# EAGLE design blinky-555 (EAGLE 9.6.2)
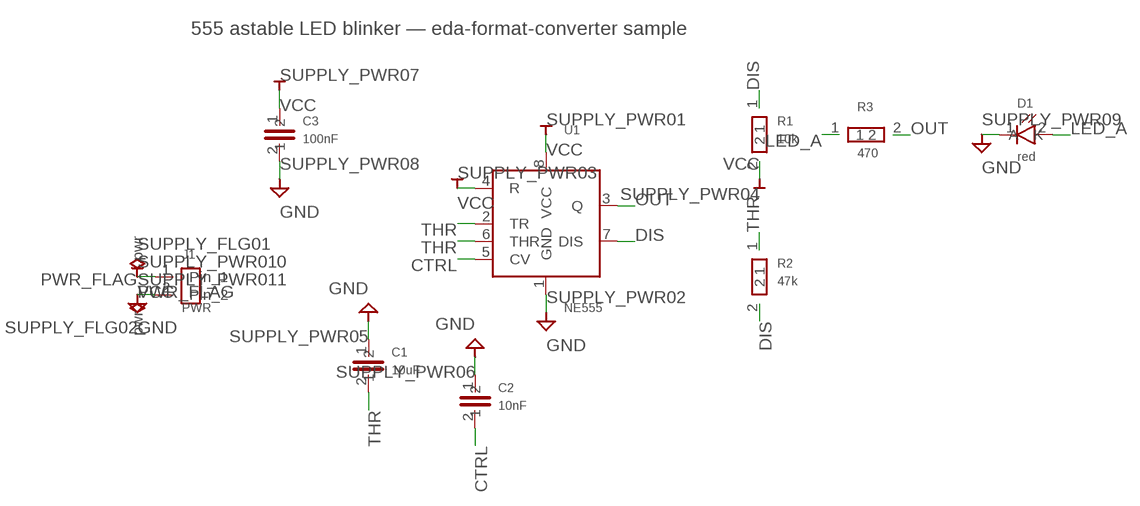
[diagram p0: schematic, sheet 1]

## Parts
C1  10uF  C  [C_PINS]
C2  10nF  C  [C_PINS]
C3  100nF  C  [C_PINS]
D1  red  LED  [LED_PINS]
J1  PWR  Conn_01x02  [PinHeader_1x02_P2.54mm_Vertical]
R1  10k  R  [R_PINS]
R2  47k  R  [R_PINS]
R3  470  R  [R_PINS]
SUPPLY_PWR01  VCC  (no package)
SUPPLY_PWR02  GND  (no package)
SUPPLY_PWR03  VCC  (no package)
SUPPLY_PWR04  VCC  (no package)
SUPPLY_PWR05  GND  (no package)
SUPPLY_PWR06  GND  (no package)
SUPPLY_PWR07  VCC  (no package)
SUPPLY_PWR08  GND  (no package)
SUPPLY_PWR09  GND  (no package)
SUPPLY_PWR010  VCC  (no package)
SUPPLY_PWR011  GND  (no package)
U1  NE555  [SOIC-8_3.9x4.9mm_P1.27mm]

## Nets
CTRL: C2.2 U1.5(CV)
DIS: R1.1 R2.2 U1.7(DIS)
GND: C1.1 C2.1 C3.2 D1.1(K) J1.2(Pin_2) SUPPLY_PWR02.GND SUPPLY_PWR05.GND SUPPLY_PWR06.GND SUPPLY_PWR08.GND SUPPLY_PWR09.GND SUPPLY_PWR011.GND U1.1(GND) ; supply symbol labelled PWR_FLAG
LED_A: D1.2(A) R3.1
OUT: R3.2 U1.3(Q)
THR: C1.2 R2.1 U1.2(TR) U1.6(THR)
VCC: C3.1 J1.1(Pin_1) R1.2 SUPPLY_PWR01.VCC SUPPLY_PWR03.VCC SUPPLY_PWR04.VCC SUPPLY_PWR07.VCC SUPPLY_PWR010.VCC U1.4(R) U1.8(VCC) ; supply symbol labelled PWR_FLAG

## Notes on the sheet
- 555 astable LED blinker — eda-format-converter sample

## Library data of the parts
C1-C3 = converted:C
D1 = converted:LED
J1 = converted:Conn_01x02
R1-R3 = converted:R
SUPPLY_PWR01 SUPPLY_PWR03 SUPPLY_PWR04 SUPPLY_PWR07 SUPPLY_PWR010 = converted:VCC
SUPPLY_PWR02 SUPPLY_PWR05 SUPPLY_PWR06 SUPPLY_PWR08 SUPPLY_PWR09 SUPPLY_PWR011 = converted:GND
U1 = converted:NE555: Precision timer

## Board
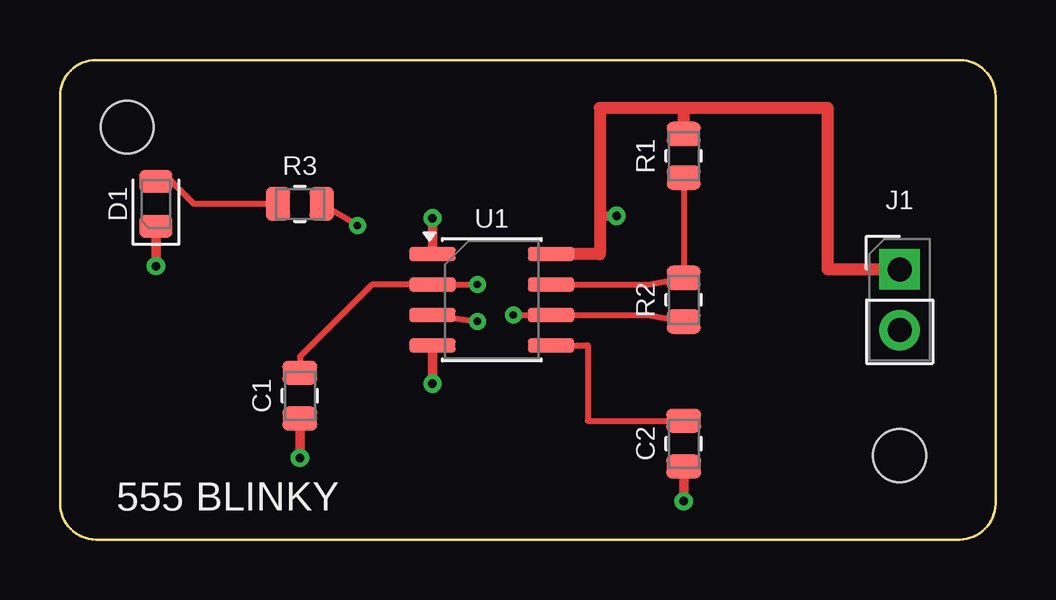
[diagram p1: board, top side]
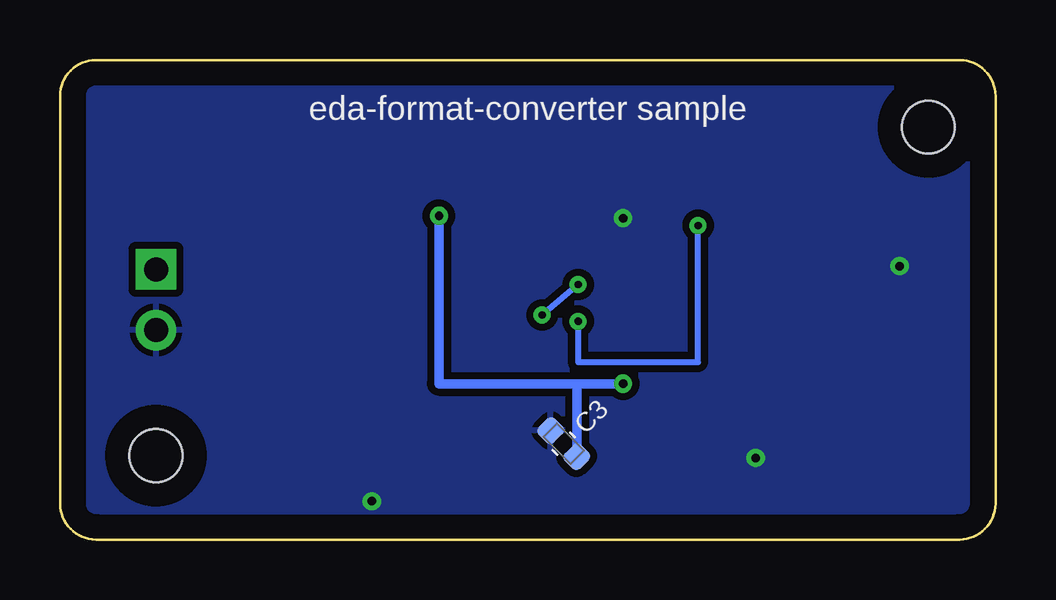
[diagram p2: board, bottom side, seen from below]

Size 39 x 20 mm. Coordinates in mm from the lower left corner, seen from the top.
Outline: 1.5,20 37.5,20 arc-90 39,18.5 39,1.5 arc-90 37.5,0 1.5,0 arc-90 0,1.5 0,18.5 arc-90 1.5,20
Copper layers (1*16): Top / Bottom
Holes 2.2 mm at 2.8,17.2 35,3.5

### Footprints (pad centres in the part's own frame; a part is rotated, then mirrored left to right if it is on the bottom)
C_0805_2012Metric = smd 1 x 1.45: 1 -0.95,0; 2 0.95,0
C_0603_1608Metric = smd 0.9 x 0.95: 1 0.775,0; 2 -0.775,0
LED_0805_2012Metric = smd 0.975 x 1.4: 1 -0.938,0; 2 0.938,0
PinHeader_1x02_P2.54mm_Vertical = drill 1 pad 1.7 square: 1 0,0 | drill 1 pad 1.7: 2 0,-2.54
R_0805_2012Metric = smd 1.025 x 1.4: 1 -0.912,0; 2 0.912,0
SOIC-8_3.9x4.9mm_P1.27mm = smd 1.95 x 0.6: 1 -2.475,1.905; 2 -2.475,0.635; 3 -2.475,-0.635; 4 -2.475,-1.905; 5 2.475,-1.905; 6 2.475,-0.635; 7 2.475,0.635; 8 2.475,1.905

### Placement (x,y rotation side)
C1  10uF  [C_0805_2012Metric]  10,6 90 top
C2  10nF  [C_0805_2012Metric]  26,4 90 top
C3  100nF  [C_0603_1608Metric]  18,4 315 bottom
D1  red  [LED_0805_2012Metric]  4,14 90 top
J1  35,11.27 0 top
R1  10k  [R_0805_2012Metric]  26,16 90 top
R2  47k  [R_0805_2012Metric]  26,10 90 top
R3  470  [R_0805_2012Metric]  10,14 0 top
U1  18,10 0 top

### Tracks (layer width: path | path; a pad name or v marks a point on that pad's centre or on a via)
CTRL
  Top 0.25: U1.5 22,8.09 22,4.95 C2.2
DIS
  Top 0.25: U1.7 24.5,10.63 R2.2 R1.1
GND  (via drill 0.35 pad 0.7)
  Top 0.4: U1.1 v15.52,13.4 | C1.1 v10,3.4 | C2.1 v26,1.6 | D1.1 v4,11.4
  pour Bottom (isolate 0.3): 0.5,19.5 38.5,19.5 38.5,0.5 0.5,0.5
LED_A
  Top 0.25: R3.1 5.6,14 4.66,14.94 D1.2
OUT  (via drill 0.3 pad 0.6)
  Top 0.25: U1.3 v17.4,9.1 | v12.4,13.1 R3.2
  Bottom 0.25: v17.4,9.1 17.4,7.4 12.4,7.4 v12.4,13.1
THR  (via drill 0.3 pad 0.6)
  Top 0.25: R2.1 24.5,9.36 U1.6 v18.9,9.36 | v17.4,10.63 U1.2 13,10.63 10,7.64 C1.2
  Bottom 0.25: v17.4,10.63 v18.9,9.36
VCC  (via drill 0.35 pad 0.7)
  Top 0.4: 22.5,13.5 v23.2,13.5 | U1.4 v15.52,6.5
  Top 0.5: J1.1 32,11.27 32,18 22.5,18 22.5,11.9 U1.8 | R1.2 26,18
  Bottom 0.4: v23.2,13.5 23.2,6.5 v15.52,6.5 | 17.45,6.5 C3.1

### Text on the board
tPlace: 555 BLINKY
bPlace: eda-format-converter sample